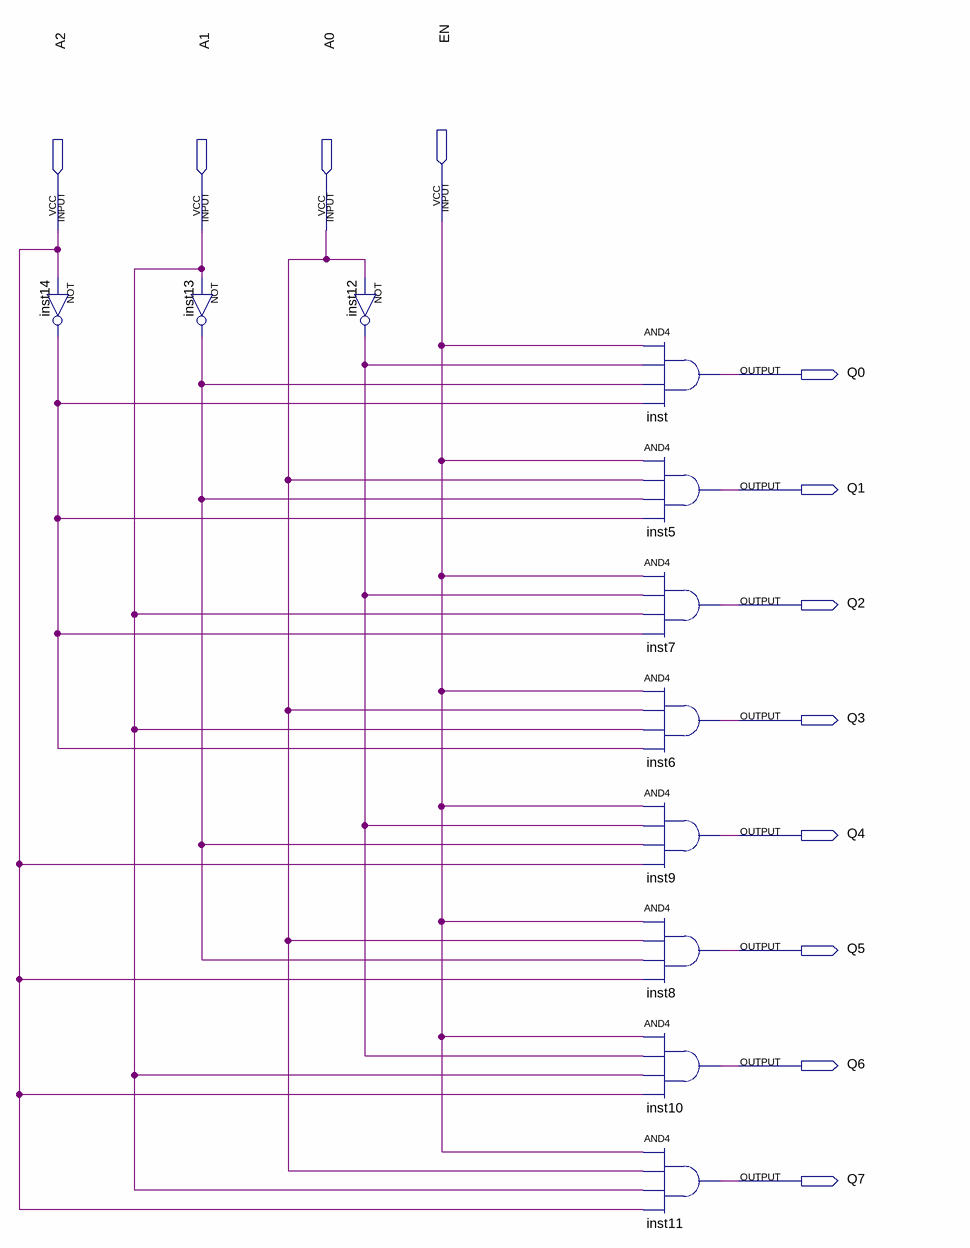
[diagram p0: schematic sheet]
// Quartus schematic decoder_3-8_en.bdf as structural Verilog: 11 symbols, 12 pins
module \decoder_3-8_en  (
  input  EN,
  input  A2,
  input  A1,
  input  A0,
  output Q0,
  output Q1,
  output Q2,
  output Q3,
  output Q4,
  output Q5,
  output Q6,
  output Q7
);

  wire inst12_out, inst13_out, inst14_out;

  not inst14 (inst14_out, A2);
  not inst13 (inst13_out, A1);
  not inst12 (inst12_out, A0);
  and inst (Q0, EN, inst12_out, inst13_out, inst14_out);
  and inst5 (Q1, EN, A0, inst13_out, inst14_out);
  and inst7 (Q2, EN, inst12_out, A1, inst14_out);
  and inst6 (Q3, EN, A0, A1, inst14_out);
  and inst9 (Q4, EN, inst12_out, inst13_out, A2);
  and inst8 (Q5, EN, A0, inst13_out, A2);
  and inst10 (Q6, EN, inst12_out, A1, A2);
  and inst11 (Q7, EN, A0, A1, A2);
endmodule
